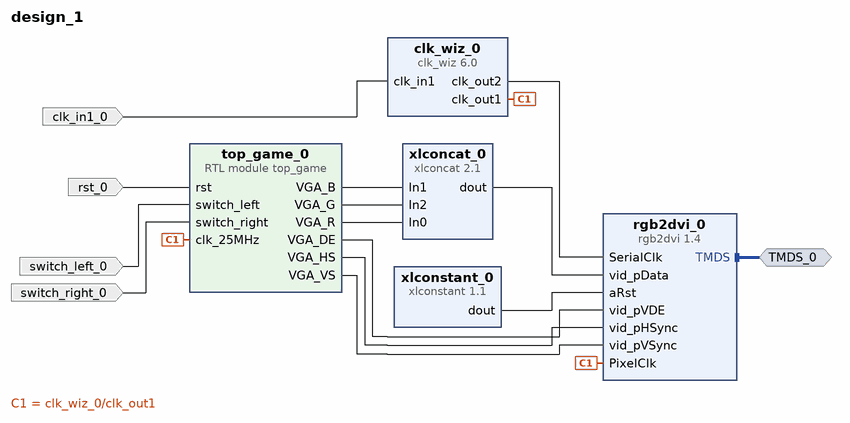
[diagram p0: block diagram of the top level]
# Vivado block design design_1, xc7z020clg400-1, Vivado 2025.2
create_bd_design design_1

create_bd_intf_port -mode Master -vlnv digilentinc.com:interface:tmds_rtl:1.0 TMDS_0
create_bd_port -dir I -type clk clk_in1_0
set_property -dict {CONFIG.FREQ_HZ 50000000} [get_bd_ports clk_in1_0]
create_bd_port -dir I switch_left_0
create_bd_port -dir I switch_right_0
create_bd_port -dir I -type rst rst_0
set_property -dict {CONFIG.POLARITY ACTIVE_HIGH} [get_bd_ports rst_0]

create_bd_cell -type ip -vlnv xilinx.com:ip:clk_wiz:6.0 clk_wiz_0
set_property -dict [list \
  CONFIG.CLKIN1_JITTER_PS 200.0 \
  CONFIG.CLKOUT1_JITTER 750.109 \
  CONFIG.CLKOUT1_PHASE_ERROR 908.603 \
  CONFIG.CLKOUT1_REQUESTED_OUT_FREQ 25.200 \
  CONFIG.CLKOUT2_JITTER 598.350 \
  CONFIG.CLKOUT2_PHASE_ERROR 908.603 \
  CONFIG.CLKOUT2_REQUESTED_OUT_FREQ 126.000 \
  CONFIG.CLKOUT2_USED true \
  CONFIG.MMCM_CLKFBOUT_MULT_F 63.000 \
  CONFIG.MMCM_CLKIN1_PERIOD 20.000 \
  CONFIG.MMCM_CLKIN2_PERIOD 10.0 \
  CONFIG.MMCM_CLKOUT0_DIVIDE_F 25.000 \
  CONFIG.MMCM_CLKOUT1_DIVIDE 5 \
  CONFIG.MMCM_DIVCLK_DIVIDE 5 \
  CONFIG.NUM_OUT_CLKS 2 \
  CONFIG.PRIM_IN_FREQ 50.000 \
  CONFIG.USE_LOCKED false \
  CONFIG.USE_RESET false \
] [get_bd_cells clk_wiz_0]
create_bd_cell -type module -reference top_game top_game_0
create_bd_cell -type ip -vlnv digilentinc.com:ip:rgb2dvi:1.4 rgb2dvi_0
set_property -dict {CONFIG.kGenerateSerialClk false} [get_bd_cells rgb2dvi_0]
create_bd_cell -type ip -vlnv xilinx.com:ip:xlconcat:2.1 xlconcat_0
set_property -dict {CONFIG.NUM_PORTS 3} [get_bd_cells xlconcat_0]
create_bd_cell -type ip -vlnv xilinx.com:ip:xlconstant:1.1 xlconstant_0
set_property -dict {CONFIG.CONST_VAL 0} [get_bd_cells xlconstant_0]

# ---- connections ----

connect_bd_intf_net [get_bd_intf_ports TMDS_0] [get_bd_intf_pins rgb2dvi_0/TMDS]
connect_bd_net -net clk_in1_0_1 [get_bd_ports clk_in1_0] [get_bd_pins clk_wiz_0/clk_in1]
connect_bd_net [get_bd_pins clk_wiz_0/clk_out1] [get_bd_pins top_game_0/clk_25MHz] [get_bd_pins rgb2dvi_0/PixelClk]
connect_bd_net [get_bd_pins clk_wiz_0/clk_out2] [get_bd_pins rgb2dvi_0/SerialClk]
connect_bd_net -net rst_0_1 [get_bd_ports rst_0] [get_bd_pins top_game_0/rst]
connect_bd_net -net switch_left_0_1 [get_bd_ports switch_left_0] [get_bd_pins top_game_0/switch_left]
connect_bd_net -net switch_right_0_1 [get_bd_ports switch_right_0] [get_bd_pins top_game_0/switch_right]
connect_bd_net [get_bd_pins top_game_0/VGA_B] [get_bd_pins xlconcat_0/In1]
connect_bd_net [get_bd_pins top_game_0/VGA_DE] [get_bd_pins rgb2dvi_0/vid_pVDE]
connect_bd_net [get_bd_pins top_game_0/VGA_G] [get_bd_pins xlconcat_0/In2]
connect_bd_net [get_bd_pins top_game_0/VGA_HS] [get_bd_pins rgb2dvi_0/vid_pHSync]
connect_bd_net [get_bd_pins top_game_0/VGA_R] [get_bd_pins xlconcat_0/In0]
connect_bd_net [get_bd_pins top_game_0/VGA_VS] [get_bd_pins rgb2dvi_0/vid_pVSync]
connect_bd_net [get_bd_pins xlconcat_0/dout] [get_bd_pins rgb2dvi_0/vid_pData]
connect_bd_net [get_bd_pins xlconstant_0/dout] [get_bd_pins rgb2dvi_0/aRst]

validate_bd_design
save_bd_design
